# EasyEDA Pro project 电脑鼠_数字量最终方案.eprj, board PCB3_1
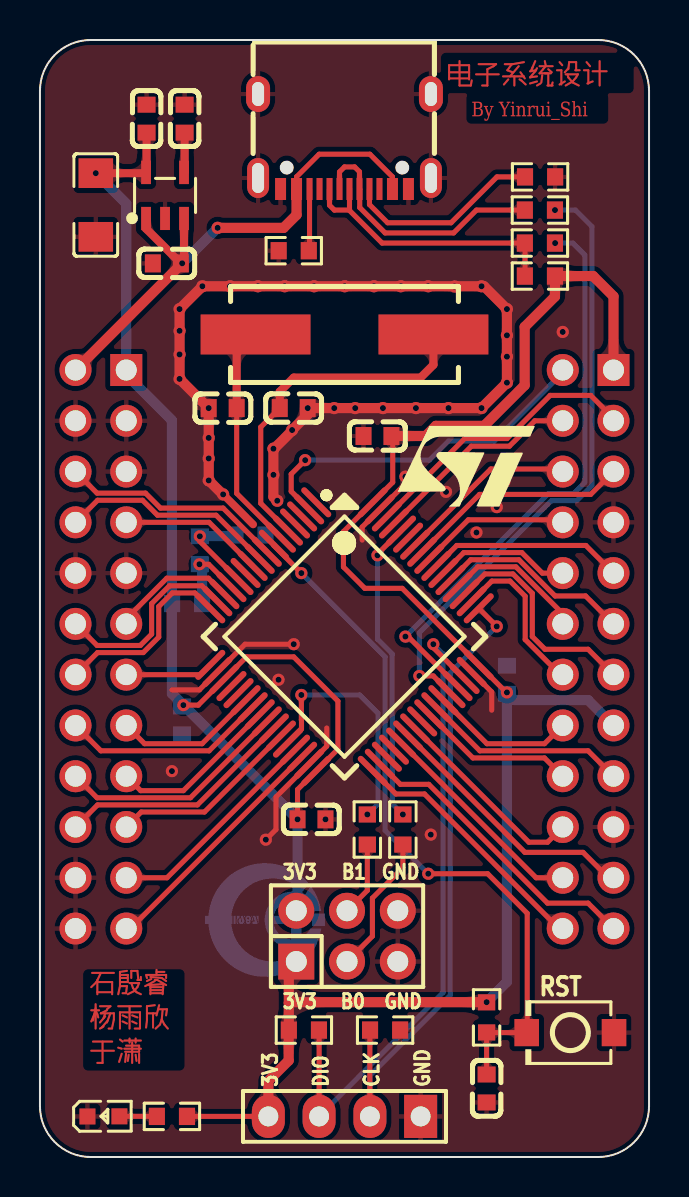
[diagram p8: board, top side]
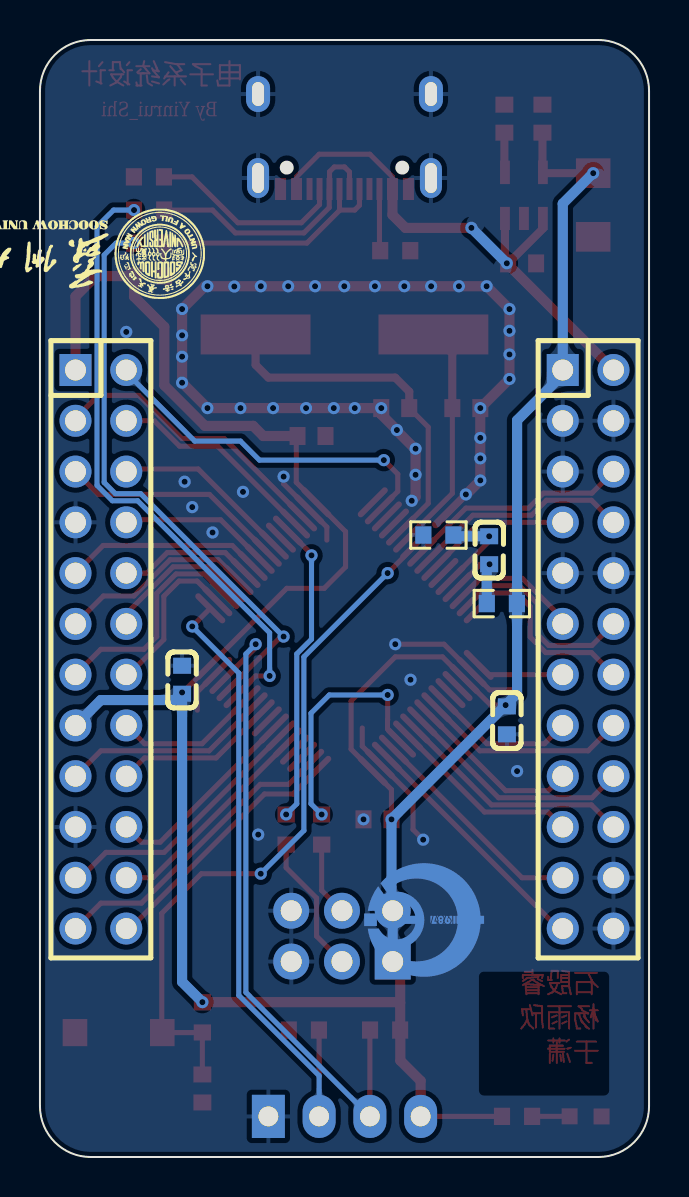
[diagram p9: board, bottom side, seen from below]

Outline 30.48 x 55.88 mm; copper layers: Top Layer, Bottom Layer. Coordinates in mm from the lower left corner of the outline.
Outline path: 0,53.34 0,2.54 arc(0.74,0.74) 2.54,0 27.94,0 arc(29.74,0.74) 30.48,2.54 30.48,53.34 arc(29.74,55.14) 27.94,55.88 2.54,55.88 arc(0.74,55.14) 0,53.34
Stack: Top Layer 0.035mm / Dielectric1 1.51mm FR4 er 4.5 / Bottom Layer 0.035mm

## Design rules (mm)
template: JLCPCB Capability(Two Layers Board)
spacing copperThickness1oz (default): track to track 0.102, other pairs 0.152 to 0.3
spacing copperThickness2oz: track to track 0.203, other pairs 0.152 to 0.3
track width copperThickness1oz (default): min 0.127, default 0.254, max 2.54
track width copperThickness2oz: min 0.203, default 0.254, max 2.54
differential pair differentialPair (default): width min 0.127, default 0.254, max 2.54; gap min 0.152, default 0.152
via viaSize (default): diameter min 0.5, default 0.61, max 10; hole min 0.3, default 0.305, max 6.3

## Placement (name value [footprint] x y rotation side)
C9  18pF  [C0603]  12.7 37.47 0 top
C11  18pF  [C0603]  9.14 37.47 180 top
C13  100nF  [C0603]  8 30.35 270 bottom
C14  100nF  [C0603]  22.35 3.43 270 top
C15  100nF  [C0603]  13.59 16.89 0 top
C16  100nF  [C0603]  23.37 23.88 90 bottom
C19  10uF  [C1206]  2.79 47.62 90 top
C21  100nF  [C0603]  16.89 36.07 0 top
C24  22nF  [C0603]  7.24 51.94 270 top
C25  100nF  [C0603]  7.11 21.84 90 bottom
C26  1uF  [C0603]  5.33 51.94 270 top
C27  1uF  [C0603]  6.35 44.7 0 top
J1  Header1x4  [HEADER1X4]  15.24 1.91 180 top
J2  2.54-2*3P针  [HDR-TH_6P-P2.54-V-M-R2-C3-S2.54-1]  15.37 11.05 0 top
LED1  XL-1608SURC-06  [LED0603-RD_RED]  3.18 2.03 0 top
R2  1kΩ  [R0603]  6.6 2.03 0 top
R5  10kΩ  [R0603]  17.27 6.35 180 top
R6  10kΩ  [R0603]  13.21 6.35 180 top
R22  10kΩ  [R0603]  22.35 6.98 90 top
R23  10kΩ  [R0603]  16.38 16.38 90 top
R24  10kΩ  [R0603]  18.16 16.38 270 top
R25  5.1kΩ  [R0603]  25.03 49.03 180 top
R26  5.1kΩ  [R0603]  12.7 45.34 0 top
R27  22Ω  [R0603]  25.02 45.72 180 top
R28  22Ω  [R0603]  25.02 47.37 0 top
R29  1.5kΩ  [R0603]  25.02 44.07 180 top
RB7  0Ω  [R0603]  7.37 27.69 0 bottom
RB8  0Ω  [R0603]  10.54 31.11 180 bottom
SW4  TS-1088-AR02016  [SW-SMD_L3.9-W3.0-P4.45]  26.54 6.22 180 top
U9  RT9193-33GB  [SOT-23-5_L3.0-W1.7-P0.95-LS2.8-BL]  6.26 48.11 0 top
U10  PZ254V-12-24P  [HDR-TH_24P-P2.54-V-F-R2-C12-S2.54-2]  27.43 25.4 270 bottom
U11  STM32F103RET6TR  [LQFP-64_L10.0-W10.0-P0.50-LS12.0-BL]  15.24 26.03 225 top
U12  PZ254V-12-24P  [HDR-TH_24P-P2.54-V-F-R2-C12-S2.54-2]  3.05 25.4 270 bottom
USB1  TYPE-C 16PIN 2MD(073)  [USB-C-SMD_TYPE-C-6PIN-2MD-073]  15.24 50.8 180 top
X1  8MHz  [CRYSTAL-SMD_L11.5-W4.8-LS12.7]  15.24 41.15 0 top

## Footprints (pads in the part's own frame, mm; a bottom-side part is the same pattern mirrored in y, then rotated)
C0603
  rect 0.8x0.9 smd: 1(-0.7,0) 2(0.7,0)
C1206
  rect 1.485x1.728 smd: 1(-1.593,0) 2(1.593,0)
CRYSTAL-SMD_L11.5-W4.8-LS12.7
  rect 5.5x2 smd: 1(-4.45,0) 2(4.45,0)
HDR-TH_6P-P2.54-V-M-R2-C3-S2.54-1
  rect 1.8x1.8 hole 1.05: 1(-2.54,-1.27)
  round 1.8 hole 1.05: 2(-2.54,1.27) 3(0,-1.27) 4(0,1.27) 5(2.54,-1.27) 6(2.54,1.27)
HDR-TH_24P-P2.54-V-F-R2-C12-S2.54-2
  rect 1.6x1.6 hole 1.05: 1(-13.97,-1.27)
  round 1.6 hole 1.05: 2(-13.97,1.27) 3(-11.43,-1.27) 4(-11.43,1.27) 5(-8.89,-1.27) 6(-8.89,1.27) 7(-6.35,-1.27) 8(-6.35,1.27) 9(-3.81,-1.27) 10(-3.81,1.27) 11(-1.27,-1.27) 12(-1.27,1.27) 13(1.27,-1.27) 14(1.27,1.27) 15(3.81,-1.27) 16(3.81,1.27) 17(6.35,-1.27) 18(6.35,1.27) 19(8.89,-1.27) 20(8.89,1.27) 21(11.43,-1.27) 22(11.43,1.27) 23(13.97,-1.27) 24(13.97,1.27)
HEADER1X4
  rect 1.651x2.159 hole 0.991x0.996: 1(-3.81,-0.127)
  oval 1.651x2.159 hole 0.991x0.996: 2(-1.27,-0.127) 3(1.27,-0.127) 4(3.81,-0.127)
LED0603-RD_RED
  rect 0.8x0.8 smd: 1(-0.799,-0.004) 2(0.799,0.004)
LQFP-64_L10.0-W10.0-P0.50-LS12.0-BL
  oval 0.3x2 smd: 1(-3.75,-5.75) 2(-3.25,-5.75) 3(-2.75,-5.75) 4(-2.25,-5.75) 5(-1.75,-5.75) 6(-1.25,-5.75) 7(-0.75,-5.75) 8(-0.25,-5.75) 9(0.25,-5.75) 10(0.75,-5.75) 11(1.25,-5.75) 12(1.75,-5.75) 13(2.25,-5.75) 14(2.75,-5.75) 15(3.25,-5.75) 16(3.75,-5.75) 33(3.75,5.75) 34(3.25,5.75) 35(2.75,5.75) 36(2.25,5.75) 37(1.75,5.75) 38(1.25,5.75) 39(0.75,5.75) 40(0.25,5.75) 41(-0.25,5.75) 42(-0.75,5.75) 43(-1.25,5.75) 44(-1.75,5.75) 45(-2.25,5.75) 46(-2.75,5.75) 47(-3.25,5.75) 48(-3.75,5.75)
  oval 2x0.3 smd: 17(5.75,-3.75) 18(5.75,-3.25) 19(5.75,-2.75) 20(5.75,-2.25) 21(5.75,-1.75) 22(5.75,-1.25) 23(5.75,-0.75) 24(5.75,-0.25) 25(5.75,0.25) 26(5.75,0.75) 27(5.75,1.25) 28(5.75,1.75) 29(5.75,2.25) 30(5.75,2.75) 31(5.75,3.25) 32(5.75,3.75) 49(-5.75,3.75) 50(-5.75,3.25) 51(-5.75,2.75) 52(-5.75,2.25) 53(-5.75,1.75) 54(-5.75,1.25) 55(-5.75,0.75) 56(-5.75,0.25) 57(-5.75,-0.25) 58(-5.75,-0.75) 59(-5.75,-1.25) 60(-5.75,-1.75) 61(-5.75,-2.25) 62(-5.75,-2.75) 63(-5.75,-3.25) 64(-5.75,-3.75)
R0603
  rect 0.806x0.864 smd: 1(-0.753,0) 2(0.753,0)
SOT-23-5_L3.0-W1.7-P0.95-LS2.8-BL
  rect 0.49x1.157 smd: 1(-0.95,-1.153) 2(0,-1.153) 3(0.95,-1.153)
  rect 0.49x1.175 smd: 4(0.95,1.153) 5(-0.95,1.153)
SW-SMD_L3.9-W3.0-P4.45
  rect 1.23x1.36 smd: 1(-2.185,0) 2(2.185,0)
USB-C-SMD_TYPE-C-6PIN-2MD-073
  rect 0.55x1.1 smd: 1(-3.2,2.375) 2(-2.4,2.375) 11(2.4,2.375) 12(3.2,2.375)
  rect 0.3x1.1 smd: 3(-1.75,2.375) 4(-1.25,2.375) 5(-0.75,2.375) 6(-0.25,2.375) 7(0.25,2.375) 8(0.75,2.375) 9(1.25,2.375) 10(1.75,2.375)
  oval 1.1x2 hole 0.6x1.5: 13(-4.325,1.825) 14(4.325,1.825)
  oval 1.2x1.8 hole 0.6x1.2: 13(-4.325,-2.375) 14(4.325,-2.375)

## Nets
3V3: C15.1 C16.1 C19.2 C21.2 C25.2 C26.2 J1.4 J2.1 J2.2 R2.2 R6.2 R22.2 R29.1 RB7.1 U9.5 U10.1 U10.15 U11.19 U11.32 U11.48 U11.64 U12.1
+5V: C27.2 U9.1 U9.3 U12.2 USB1.2 USB1.11
A3V3: C13.2 RB7.2 U11.13
AGND: C13.1 RB8.2 U11.12
GND: C9.2 C11.2 C14.2 C15.2 C16.2 C19.1 C21.1 C24.1 C25.1 C26.1 C27.1 J1.1 J2.5 J2.6 LED1.1 R5.1 R25.1 R26.1 RB8.1 SW4.1 U9.2 U10.7 U10.19 U11.18 U11.31 U11.47 U11.63 U12.3 U12.4 U12.5 U12.9 U12.10 U12.22 U12.24 USB1.1 USB1.12 USB1.13 USB1.14
BAT_ADC: U11.27 U12.19
BEEP: U11.26 U12.20
BOOT0: R24.1 U11.60
BOOT1: R23.2 U11.28
DETECT0: U11.25 U12.18
DETECT1: U11.16 U12.14
DETECT2: U11.9 U12.8
DETECT3: U11.8 U12.6
DIR_L1: U10.16 U11.43
DIR_L2: U10.17 U11.42
DIR_R1: U10.5 U11.57
DIR_R2: U10.8 U11.56
ENC_LA: U11.22 U12.15
ENC_LB: U11.23 U12.16
ENC_RA: U11.14 U12.11
ENC_RB: U11.15 U12.12
IMU_SCL: U10.4 U11.61
IMU_SDA: U10.3 U11.62
IR0: U11.24 U12.17
IR1: U11.17 U12.13
IR2: U11.10 U12.7
IR3: U10.2 U11.2
KEY0: U10.22 U11.37
KEY1: U10.21 U11.38
KEY2: U10.20 U11.39
LED0: U10.24 U11.33
LED1: U10.23 U11.34
OLED_BLK: U10.14 U11.50
OLED_CS: U10.13 U11.51
OLED_DC: U10.12 U11.52
OLED_RST: U10.11 U11.53
OLED_SCL: U10.9 U11.55
OLED_SDA: U10.10 U11.54
OSC0: C11.1 U11.6 X1.1
OSC1: C9.1 U11.5 X1.2
PWM_L: U10.18 U11.41
PWM_R: U10.6 U11.58
RST: C14.1 R22.1 SW4.2 U11.7
RX: U11.30 U12.23
SWCLK: J1.2 R5.2 U11.49
SWDIO: J1.3 R6.1 U11.46
TX: U11.29 U12.21
USB_DN: R28.2 U11.44
USB_DP: R27.1 U11.45
$1N4011: J2.3 R24.2
$1N4016: J2.4 R23.1
$1N4294: R25.2 USB1.4
$1N4320: R26.2 USB1.10
$1N4425: R28.1 USB1.5 USB1.7
$1N4708: R27.2 R29.2 USB1.6 USB1.8
$1N8850: C24.2 U9.4
$1N8853: LED1.2 R2.1

Pads without a net: U11 1 3 4 11 20 21 35 36 40 59; USB1 3 9

## Via types
v1: diameter 0.61, hole 0.305, Top Layer to Bottom Layer, 69 vias

## Routing (per net, layer and track width the routed paths; a pad name or vN(x,y) marks a point on that pad's centre or on a via; arc(x,y) is an arc through that point)
3V3: length 147.8
  Top Layer w0.254: R2.2 J1.4 ; v1(12.89,16.89) 12.89,18.38 U11.32 14.91,20.4 14.91,22.81 12.7,25.02 10.34,25.02 U11.19 7.92,22.61 v1(7.18,22.61) ; v1(23.37,23.24) 23.34,23.24 U11.48 18.13,28.45 16.26,28.45 15.19,29.52 15.19,31.29 U11.64 17.65,33.75 17.65,35.88 17.84,36.07
  Top Layer w0.406: v1(2.79,49.22) 5.27,49.22 U9.5 5.33,49.28 C26.2
  Top Layer w0.508: 12.45,7.72 R6.2 12.45,6.34 12.45,4.83 11.43,3.81 J1.4 ; 12.45,7.72 12.48,7.75 v1(22.35,7.75) ; 12.45,7.72 12.45,9.41 J2.1 ; U10.1 28.7,43.05 27.69,44.07 R29.1 25.77,43.04 24.26,41.53 24.26,38.61 22.22,36.58 19.81,36.58 19.3,36.07 17.84,36.07
  Bottom Layer w0.508: v1(2.79,49.22) 4.32,47.69 U12.1 4.32,39.14 6.6,36.85 6.6,23.18 v1(7.18,22.61) 12.89,16.89 v1(12.89,16.89) 12.89,12.38 J2.2 J2.1 ; v1(22.35,7.75) 23.37,8.76 C16.1 v1(23.37,23.24) 23.75,22.86 27.43,22.86 U10.15
+5V: length 27.8
  Top Layer w0.254: USB1.11 12.84,49.03 13.97,50.17 16.51,50.17 17.64,49.03 USB1.2
  Top Layer w0.406: v1(7.12,44.71) 7.21,44.8 U9.3 ; U9.1 5.31,46.44 C27.2
  Top Layer w0.508: U12.2 v1(7.12,44.71) ; v1(8.89,46.48) 12.19,46.48 12.84,47.13 USB1.11
  Bottom Layer w0.508: v1(7.12,44.71) v1(8.89,46.48)
A3V3: length 4.1
  Top Layer w0.254: U11.13 8.44,29.65 v1(7.98,29.65)
  Bottom Layer w0.508: RB7.2 8.12,29.52 v1(7.98,29.65)
AGND: length 4.8
  Top Layer w0.254: v1(8,31.05) 8,30.8 U11.12
  Bottom Layer w0.508: 9.79,30.99 9.72,31.05 v1(8,31.05)
GND: length 69.6
  Top Layer w0.254: v1(18.29,34.04) 18.29,33.68 17.01,32.4 16.12,31.52 16.12,30.86 ; U11.47 22.61,23.27 22.61,22.35 ; v1(11.3,15.88) 11.81,16.38 11.81,18.01 U11.31 14.35,20.55 14.35,21.46 ; v1(12.7,25.65) 10.26,25.65 U11.18 7.98,23.37 6.6,23.37
  Top Layer w0.381: v1(9.17,33.15) 10.67,31.65
  Top Layer w0.508: v1(9.17,33.15) 9.14,33.15 v1(8.44,33.85) v1(8.44,34.95) v1(8.44,35.97) v1(8.44,37.47) v1(6.99,38.92) v1(6.99,40.15) v1(6.99,41.33) v1(6.99,42.42) v1(8.13,43.56) v1(9.51,43.56) v1(10.91,43.56) v1(12.25,43.56) v1(13.72,43.56) v1(15.25,43.56) v1(16.71,43.56) v1(18.06,43.56) v1(19.43,43.56) v1(22.1,43.56) 22.22,43.56 v1(23.37,42.42) v1(23.37,41.11) v1(23.37,40.04) v1(23.37,38.73) v1(22.1,37.47) v1(20.44,37.47) v1(18.81,37.47) v1(17.16,37.47) v1(15.78,37.47) v1(14.73,37.47) v1(13.4,37.47) 13.4,37.15 v1(12.62,36.37) 12.62,36.33 11.72,35.43 v1(11.68,35.43) v1(11.68,34.13) 11.68,33.02 v1(11.87,32.83)
  vias: v1(6.6,19.3) v1(11.94,23.88) v1(14.29,16.89) v1(19.56,16.13) v1(20.32,33.27) v1(20.75,43.55) v1(21.84,31.24) v1(22.86,32.51) v1(23.24,33.78) v1(26.16,41.28)
BAT_ADC: length 9.6
  Top Layer w0.254: U12.19 5.07,17.26 8.23,17.26 U11.27
BEEP: length 12
  Top Layer w0.254: 11.7,21.44 7.88,17.61 2.88,17.61 U12.20
BOOT0: length 15.2
  Top Layer w0.254: v1(16.89,30.1) 16.89,30.16 U11.60
  Bottom Layer w0.254: v1(16.89,30.1) 16.89,25.9 17.63,25.17 17.63,17.67 v1(18.16,17.14)
BOOT1: length 12.2
  Top Layer w0.254: U11.28 13.09,21.41 13.09,21.86 13.08,21.87 v1(13.08,23.11)
  Bottom Layer w0.254: v1(13.08,23.11) 16,23.11 16.92,22.2 16.92,17.67 v1(16.38,17.14)
DETECT0: length 11.6
  Top Layer w0.254: 11.35,21.79 7.53,17.97 2.86,17.97 U12.18
DETECT1: length 9.7
  Top Layer w0.254: 8.52,27.45 7.75,28.22 6.62,28.22 5.94,27.54 5.94,26.01 5.17,25.23 2.88,25.23 U12.14
DETECT2: length 10.9
  Top Layer w0.254: U11.9 8.82,32.11 5.88,32.11 5.13,32.86 2.88,32.86 U12.8
DETECT3: length 11.2
  Top Layer w0.254: 11.35,30.28 9.17,32.46 6.03,32.46 5.28,33.21 2.86,33.21 U12.6
DIR_L1: length 7.3
  Top Layer w0.254: 20.19,22.85 22.37,20.68 25.25,20.68 U10.16
DIR_L2: length 10.3
  Top Layer w0.254: U11.42 22.02,20.32 27.43,20.32 U10.17
DIR_R1: length 11.2
  Top Layer w0.254: U10.5 27.56,33.15 22,33.15 19.13,30.28
DIR_R2: length 7.5
  Top Layer w0.254: U11.56 21.44,31.88 26.03,31.88 U10.8
ENC_LA: length 7.3
  Top Layer w0.254: 10.29,22.85 8.11,20.68 5.23,20.68 U12.15
ENC_LB: length 10.3
  Top Layer w0.254: U11.23 8.46,20.32 3.05,20.32 U12.16
ENC_RA: length 6.3
  Top Layer w0.254: U11.14 8.43,28.96 6.35,28.96 4.32,26.92 U12.11
ENC_RB: length 10
  Top Layer w0.254: U11.15 8.1,28.58 6.48,28.58 5.59,27.69 5.59,26.16 5.02,25.59 2.86,25.59 U12.12
IMU_SCL: length 10.6
  Top Layer w0.254: U10.4 24.76,36.83 23.5,35.56 21.59,35.56 17.72,31.69 17.72,31.69
IMU_SDA: length 14.4
  Top Layer w0.254: 17.36,32.05 21.26,35.94 23.37,35.94 25.53,38.1 27.56,38.1 28.7,36.96 U10.3
IR0: length 8.6
  Top Layer w0.254: U11.24 7.18,18.33 5.04,18.33 U12.17
IR1: length 4.4
  Top Layer w0.254: U12.13 8.03,24.13 U11.17
IR2: length 7.2
  Top Layer w0.254: U12.7 8.46,31.75 U11.10
IR3: length 18
  Top Layer w0.254: 13.47,32.4 12.57,33.3 12.57,34.16 v1(13.27,34.86)
  Bottom Layer w0.254: v1(13.27,34.86) 19.49,34.86 20.45,35.81 22.73,35.81 26.16,39.24 U10.2
KEY0: length 10.9
  Top Layer w0.254: U10.22 24.83,13.97 U11.37
KEY1: length 13.2
  Top Layer w0.254: U11.38 24.27,15.24 27.18,15.24 28.45,13.97 U10.21
KEY2: length 10.1
  Top Layer w0.254: U10.20 25.4,15.75 24.47,15.75 18.78,21.44
LED0: length 12.8
  Top Layer w0.254: U11.33 17.81,18.16 19.24,18.16 25.97,11.43 U10.24
LED1: length 15.1
  Top Layer w0.254: U11.34 18.03,18.64 19.46,18.64 25.4,12.7 27.43,12.7 U10.23
OLED_BLK: length 8.2
  Top Layer w0.254: U10.14 26.04,24.13 24.28,25.89 24.28,28.05 23.52,28.81 22.61,28.81 U11.50
OLED_CS: length 11.2
  Top Layer w0.254: U11.51 21.25,28.16 22.27,29.17 23.67,29.17 24.64,28.2 24.64,26.03 25.27,25.4 27.43,25.4 U10.13
OLED_DC: length 7.2
  Top Layer w0.254: U11.52 21.91,29.52 23.82,29.52 26.16,27.18 U10.12
OLED_RST: length 9.9
  Top Layer w0.254: U10.11 27.31,28.07 25.78,28.07 23.97,29.88 21.56,29.88 U11.53
OLED_SCL: length 9.9
  Top Layer w0.254: U11.55 20.86,30.59 27.32,30.59 U10.9
OLED_SDA: length 6.8
  Top Layer w0.254: U11.54 21.21,30.24 24.11,30.24 25.14,29.21 U10.10
OSC0: length 11.5
  Top Layer w0.254: U11.6 9.84,33.2 C11.1
  Top Layer w0.406: C11.1 9.84,40.2 X1.1
OSC1: length 17.7
  Top Layer w0.254: U11.5 11.05,32.7 11.05,36.51 C9.1
  Top Layer w0.406: C9.1 12,38.29 12.7,38.99 19.05,38.99 19.69,39.63 X1.2
PWM_L: length 8
  Top Layer w0.254: U11.41 21.66,19.96 25.25,19.96 U10.18
PWM_R: length 9
  Top Layer w0.254: U10.6 26.03,34.42 22.56,34.42 U11.58
RST: length 35.5
  Top Layer w0.254: C14.1 R22.1 22.36,6.22 SW4.2 24.38,6.25 24.38,12.19 22.4,14.17 v1(19.43,14.17) ; v1(13.08,29.21) 11.7,30.59 U11.7
  Bottom Layer w0.254: v1(19.43,14.17) 17.27,16.33 17.27,25.02 v1(13.08,29.21)
RX: length 12.4
  Top Layer w0.254: U12.23 4.52,11.43 13.12,20.02
SWCLK: length 32.7
  Top Layer w0.254: v1(22.86,26.54) 22.86,26.55 21.96,27.45 ; R5.2 16.51,6.34 J1.2
  Bottom Layer w0.254: J1.2 16.51,4.07 20.53,8.09 20.53,24.21 v1(22.86,26.54)
SWDIO: length 33.1
  Top Layer w0.254: v1(19.69,25.65) 19.69,25.48 U11.46 ; R6.1 13.97,6.34 J1.3
  Bottom Layer w0.254: v1(19.69,25.65) 20.17,25.16 20.17,8.24 J1.3
TX: length 11.1
  Top Layer w0.254: 12.76,20.38 6.36,13.97 U12.21
USB_DN: length 30.9
  Top Layer w0.254: v1(18.99,24.07) 19.68,24.07 20.54,23.21
  Bottom Layer w0.254: v1(18.99,24.07) 18.99,26.23 25.59,32.83 26.86,32.83 27.62,33.6 27.62,46.55 26.8,47.37 v1(25.77,47.37)
USB_DP: length 28.9
  Top Layer w0.254: v1(25.78,45.72) R27.1 ; U11.45 18.42,26.03 v1(18.29,26.03)
  Bottom Layer w0.254: v1(18.29,26.03) 18.29,26.03 25.44,33.19 26.71,33.19 27.27,33.74 27.27,45.12 26.67,45.72 v1(25.78,45.72)
$1N4011: length 7
  Top Layer w0.254: J2.3 16.64,11.05 16.64,12.95 18.16,14.48 R24.2
$1N4016: length 3.7
  Top Layer w0.254: J2.4 16.38,13.33 R23.1
$1N4294: length 9.9
  Top Layer w0.254: USB1.4 16.49,47.64 17.4,46.74 20.57,46.74 22.87,49.03 R25.2
$1N4320: length 3.1
  Top Layer w0.254: USB1.10 13.49,45.38 R26.2
$1N4425: length 13.1
  Top Layer w0.254: R28.1 21.84,47.37 20.7,46.23 17.27,46.23 16,47.5 16,48.41 USB1.5 15.99,49.29 15.75,49.53 15.24,49.53 14.99,49.28 USB1.7
$1N4708: length 14.1
  Top Layer w0.254: 15.47,47.37 17.12,45.72 R27.2 24.27,45.71 24.27,44.08 ; 15.47,47.37 15.49,47.39 USB1.6 ; 15.47,47.37 14.73,47.37 14.49,47.61 USB1.8
$1N8850: length 2
  Top Layer w0.406: C24.2 7.24,49.29 U9.4
$1N8853: length 1.9
  Top Layer w0.254: LED1.2 5.85,2.04 R2.1

## Copper pours and planes (outline as drawn; the poured copper is in the pictures)
GND on Top Layer: -2.67,56.9 36.96,56.9 36.96,-2.54 -2.67,-2.54
GND on Top Layer: -13.84,60.07 50.04,60.07 50.04,-7.37 -13.84,-7.37
GND on Bottom Layer: -6.73,60.45 32,60.45 32,-1.14 -6.73,-1.14

Small or netless copper shapes (teardrops, artwork), in the pictures only: 54 on Bottom Layer, 168 on Top Layer

## Text on the board
Top Layer: By Yinrui_Shi | 石殷睿 / 杨雨欣 / 于潇 | 电子系统设计
Top Solder Mask Layer: By Yinrui_Shi | 石殷睿 / 杨雨欣 / 于潇 | 电子系统设计
Top Silkscreen Layer: B1 | 3V3 | DIO | CLK | GND | B0 | RST
